# Altium schematic sheet Main_Sheet.SchDoc: =Projectname
size A4; SheetNumber: 1; SheetTotal: 1
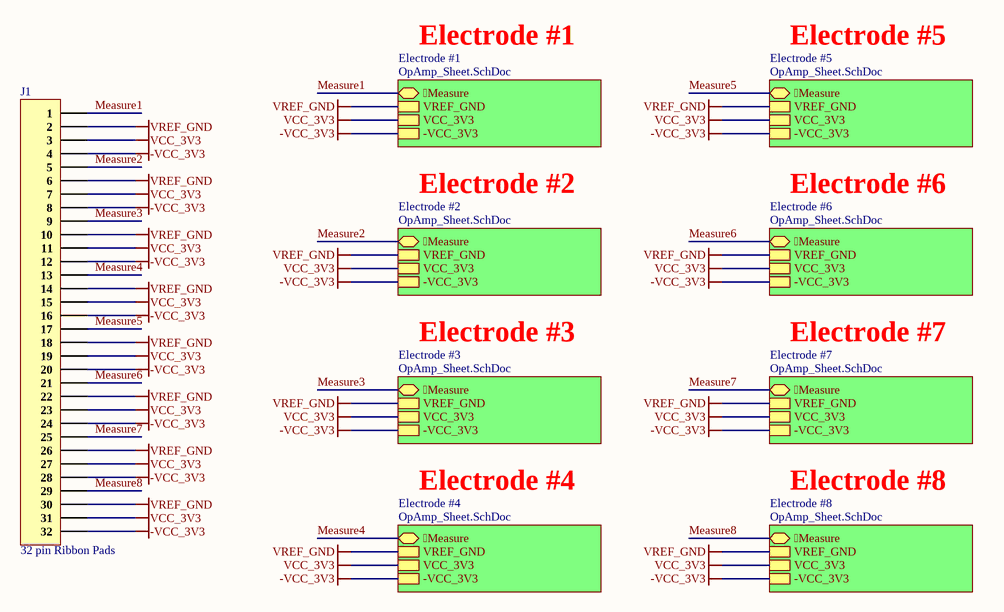
[diagram p0: Main_Sheet.SchDoc]

## Parts
J1  32 pin Ribbon Pads  [32 pin Ribbon Pads.]

## Sub-sheets
Electrode #1 = OpAmp_Sheet.SchDoc: Measure (bidir), VCC_3V3, -VCC_3V3, VREF_GND
Electrode #2 = OpAmp_Sheet.SchDoc: Measure (bidir), VCC_3V3, -VCC_3V3, VREF_GND
Electrode #3 = OpAmp_Sheet.SchDoc: Measure (bidir), VCC_3V3, -VCC_3V3, VREF_GND
Electrode #4 = OpAmp_Sheet.SchDoc: Measure (bidir), VCC_3V3, -VCC_3V3, VREF_GND
Electrode #5 = OpAmp_Sheet.SchDoc: Measure (bidir), VCC_3V3, -VCC_3V3, VREF_GND
Electrode #6 = OpAmp_Sheet.SchDoc: Measure (bidir), VCC_3V3, -VCC_3V3, VREF_GND
Electrode #7 = OpAmp_Sheet.SchDoc: Measure (bidir), VCC_3V3, -VCC_3V3, VREF_GND
Electrode #8 = OpAmp_Sheet.SchDoc: Measure (bidir), VCC_3V3, -VCC_3V3, VREF_GND

## Nets
-VCC_3V3: J1.4 J1.8 J1.12 J1.16 J1.20 J1.24 J1.28 J1.32 ; sheet Electrode #1/-VCC_3V3, sheet Electrode #2/-VCC_3V3, sheet Electrode #3/-VCC_3V3, sheet Electrode #4/-VCC_3V3, sheet Electrode #5/-VCC_3V3, sheet Electrode #6/-VCC_3V3, sheet Electrode #7/-VCC_3V3, sheet Electrode #8/-VCC_3V3
VCC_3V3: J1.3 J1.7 J1.11 J1.15 J1.19 J1.23 J1.27 J1.31 ; sheet Electrode #1/VCC_3V3, sheet Electrode #2/VCC_3V3, sheet Electrode #3/VCC_3V3, sheet Electrode #4/VCC_3V3, sheet Electrode #5/VCC_3V3, sheet Electrode #6/VCC_3V3, sheet Electrode #7/VCC_3V3, sheet Electrode #8/VCC_3V3
VREF_GND: J1.2 J1.6 J1.10 J1.14 J1.18 J1.22 J1.26 J1.30 ; sheet Electrode #1/VREF_GND, sheet Electrode #2/VREF_GND, sheet Electrode #3/VREF_GND, sheet Electrode #4/VREF_GND, sheet Electrode #5/VREF_GND, sheet Electrode #6/VREF_GND, sheet Electrode #7/VREF_GND, sheet Electrode #8/VREF_GND
Measure1: J1.1 ; sheet Electrode #1/Measure
Measure2: J1.5 ; sheet Electrode #2/Measure
Measure3: J1.9 ; sheet Electrode #3/Measure
Measure4: J1.13 ; sheet Electrode #4/Measure
Measure5: J1.17 ; sheet Electrode #5/Measure
Measure6: J1.21 ; sheet Electrode #6/Measure
Measure7: J1.25 ; sheet Electrode #7/Measure
Measure8: J1.29 ; sheet Electrode #8/Measure

## Notes on the sheet
- Electrode #1
- Electrode #5
- Electrode #2
- Electrode #6
- Electrode #3
- Electrode #7
- Electrode #4
- Electrode #8
- File:
- Title:
- Date:
- Page
- Num:
- Total:
- Drawn By: Huzaifa Ali

## Library data of the parts
J1 = 32 pin Ribbon Pads: Ribbon wire Connection Pads